# EAGLE board EPGcontrolSWAP (EAGLE 7.7.0)
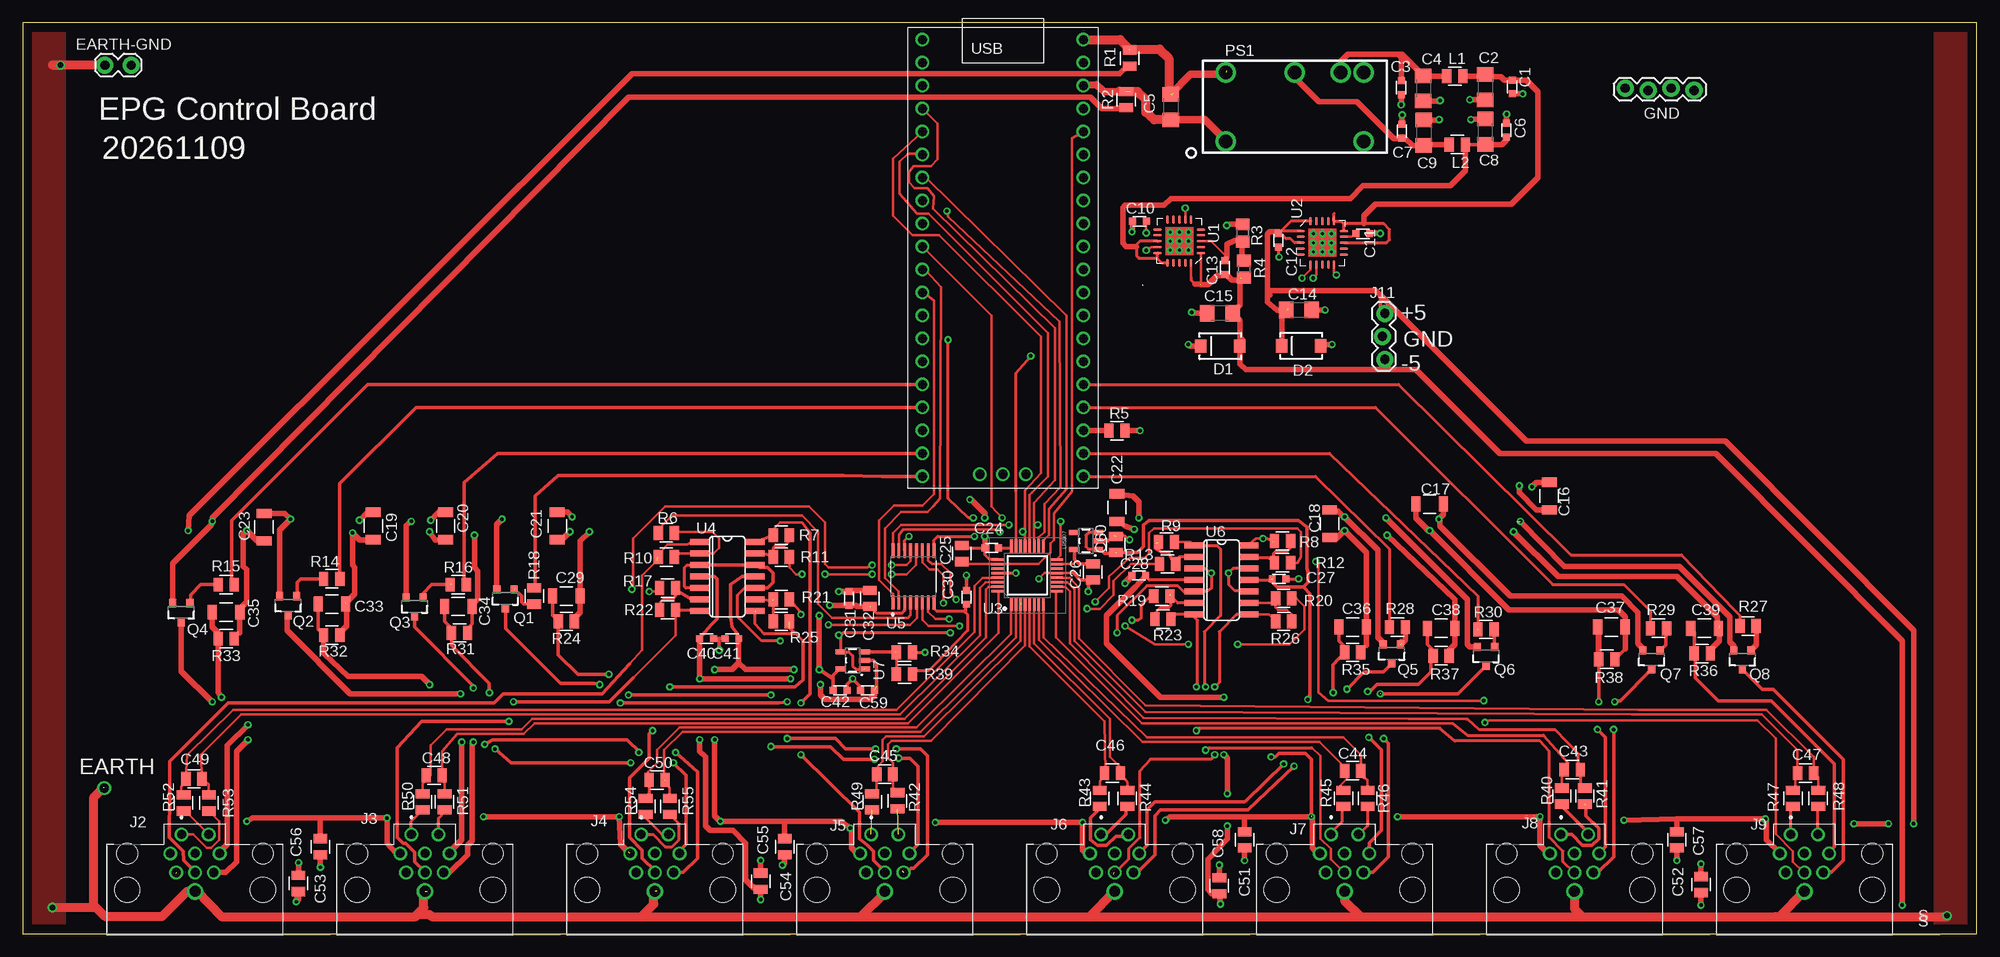
[diagram p1: board, top side]
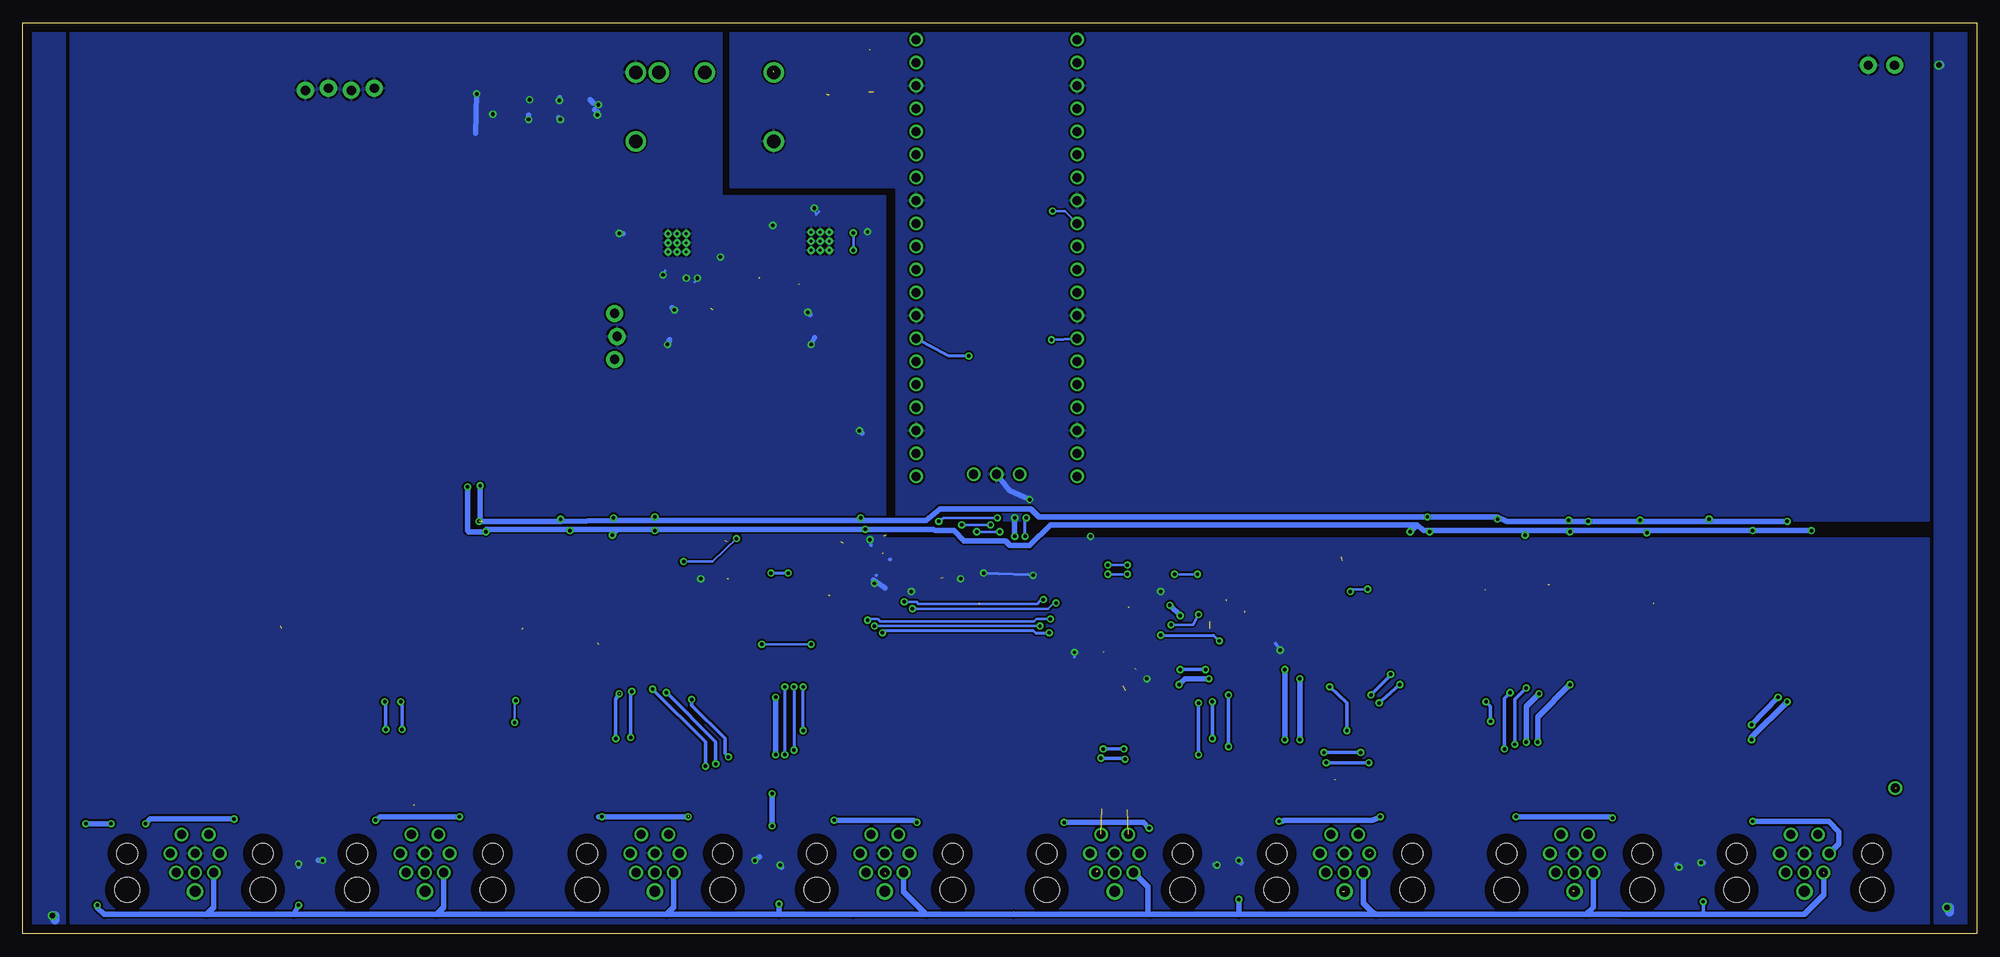
[diagram p2: board, bottom side, seen from below]

Size 215.9 x 100.71 mm. Coordinates in mm from the lower left corner, seen from the top.
Outline: 0,0 215.9,0 215.9,100.71 0,100.71 0,0
Copper layers (1*16): Top 0.035mm / dielectric 1.5mm / Bottom 0.035mm
Design rules "default *": minimum track width 10mil, minimum drill 10mil, track to track 8mil, track to pad 7mil, pad to pad 7mil, via to via 8mil, smd to smd 8mil, copper to edge 40mil, drill to drill 8mil, minimum pad ring 10mil, minimum via ring 8mil, stop-mask expansion 4mil, vias tented up to drill 0mil, thermal gap 10mil

## Footprints (pad centres in the part's own frame; a part is rotated, then mirrored left to right if it is on the bottom)
0603S = smd 0.762 x 0.762: 1 -0.762,0; 2 0.762,0
C1206 = smd 1.6 x 1.8: 1 -1.4,0; 2 1.4,0
1206S = smd 1.016 x 1.651: 1 -1.524,0; 2 1.524,0
0805S = smd 1.016 x 1.524: 1 -0.889,0; 2 0.889,0
SMA-DIODE = smd 1.27 x 1.47: A -2.15,0; C 2.15,0
1X02_LOCK = drill 1.016 pad 1.88: 1 -0.178,0; 2 2.718,0
1X04_LOCK = drill 1.016 pad 1.88: 1 0,0.127; 2 2.54,-0.127; 3 5.08,0.127; 4 7.62,-0.127
PAD_040 = drill 1.016: P$1 0,0
TENSILITY_54-00248 = drill 1 pad 1.4: 1 -1.5,2.1; 2 1.5,2.1; 3 2.725,0; 4 2.075,-2.1; 5 0,-2.1; 6 -2.075,-2.1; 7 -2.725,0; 8 0,0 | drill 1.2 pad 1.7: S1 0,-4.191 | hole 2.3: -7.5,0; 7.5,0 | hole 2.8: -7.5,-4; 7.5,-4
1X03_LOCK = drill 1.016 pad 1.88: 1 0,0.127; 2 2.54,-0.127; 3 5.08,0.127
SOT23-5 = smd 0.55 x 1.2: 1 -0.95,-1.3; 2 0,-1.3; 3 0.95,-1.3; 4 0.95,1.3; 5 -0.95,1.3
PDM2 = drill 1.5: 1 -7.62,-3.81; 7 7.62,-3.81; 8 7.62,3.81; 9 5.08,3.81; 11 0,3.81; 14 -7.62,3.81
SOT23-3 = smd 0.8 x 0.9: 1 -0.95,-1; 2 0.95,-1; 3 0,1.1
R0805 = smd 1.3 x 1.5: 1 -0.95,0; 2 0.95,0
VQFN-20-5X5 = smd 0.95 x 0.3: P$1 -2.4,1.3; P$2 -2.4,0.65; P$3 -2.4,0; P$4 -2.4,-0.65; P$5 -2.4,-1.3; P$11 2.4,-1.3; P$12 2.4,-0.65; P$13 2.4,0; P$14 2.4,0.65; P$15 2.4,1.3 | smd 0.3 x 0.95: P$6 -1.3,-2.4; P$7 -0.65,-2.4; P$8 0,-2.4; P$9 0.65,-2.4; P$10 1.3,-2.4; P$16 1.3,2.4; P$17 0.65,2.4; P$18 0,2.4; P$19 -0.65,2.4; P$20 -1.3,2.4 | drill 0.305: PAD1 -1,1; PAD2 0,1; PAD3 1,1; PAD4 -1,0; PAD5 0,0; PAD6 1,0; PAD7 -1,-1; PAD8 0,-1; PAD9 1,-1
QFP50P700X700X120-32N = smd 1.45 x 0.3: 1 -3.225,1.75; 2 -3.225,1.25; 3 -3.225,0.75; 4 -3.225,0.25; 5 -3.225,-0.25; 6 -3.225,-0.75; 7 -3.225,-1.25; 8 -3.225,-1.75; 17 3.225,-1.75; 18 3.225,-1.25; 19 3.225,-0.75; 20 3.225,-0.25; 21 3.225,0.25; 22 3.225,0.75; 23 3.225,1.25; 24 3.225,1.75 | smd 0.3 x 1.45: 9 -1.75,-3.225; 10 -1.25,-3.225; 11 -0.75,-3.225; 12 -0.25,-3.225; 13 0.25,-3.225; 14 0.75,-3.225; 15 1.25,-3.225; 16 1.75,-3.225; 25 1.75,3.225; 26 1.25,3.225; 27 0.75,3.225; 28 0.25,3.225; 29 -0.25,3.225; 30 -0.75,3.225; 31 -1.25,3.225; 32 -1.75,3.225
SO14 = smd 0.66 x 2.032: 1 -3.81,-3.073; 2 -2.54,-3.073; 3 -1.27,-3.073; 4 0,-3.073; 5 1.27,-3.073; 6 2.54,-3.073; 7 3.81,-3.073; 8 3.81,3.073; 9 2.54,3.073; 10 1.27,3.073; 11 0,3.073; 12 -1.27,3.073; 13 -2.54,3.073; 14 -3.81,3.073
SOP65P640X120-16N = smd 1.57 x 0.41: 1 -2.87,2.275; 2 -2.87,1.625; 3 -2.87,0.975; 4 -2.87,0.325; 5 -2.87,-0.325; 6 -2.87,-0.975; 7 -2.87,-1.625; 8 -2.87,-2.275; 9 2.87,-2.275; 10 2.87,-1.625; 11 2.87,-0.975; 12 2.87,-0.325; 13 2.87,0.325; 14 2.87,0.975; 15 2.87,1.625; 16 2.87,2.275
FT_RASPBERRY-PI-PICO_TH = drill 1: 1 -8.55,24.03; 2 -8.55,21.49; 3 -8.55,18.95; 4 -8.55,16.41; 5 -8.55,13.87; 6 -8.55,11.33; 7 -8.55,8.79; 8 -8.55,6.25; 9 -8.55,3.71; 10 -8.55,1.17; 11 -8.55,-1.37; 12 -8.55,-3.91; 13 -8.55,-6.45; 14 -8.55,-8.99; 15 -8.55,-11.53; 16 -8.55,-14.07; 17 -8.55,-16.61; 18 -8.55,-19.15; 19 -8.55,-21.69; 20 -8.55,-24.23; 21 9.23,-24.23; 22 9.23,-21.69; 23 9.23,-19.15; 24 9.23,-16.61; 25 9.23,-14.07; 26 9.23,-11.53; 27 9.23,-8.99; 28 9.23,-6.45; 29 9.23,-3.91; 30 9.23,-1.37; 31 9.23,1.17; 32 9.23,3.71; 33 9.23,6.25; 34 9.23,8.79; 35 9.23,11.33; 36 9.23,13.87; 37 9.23,16.41; 38 9.23,18.95; 39 9.23,21.49; 40 9.23,24.03; GND 0.34,-24; SWCLK -2.2,-24; SWDIO 2.88,-24

## Placement (x,y rotation side)
C1  0.1  [0603S]  164.56,93.61 270 top
C2  10  [C1206]  161.56,93.57 270 top
C3  0.1  [0603S]  152.3,93.52 270 top
C4  10  [C1206]  154.74,93.44 270 top
C5  10  [C1206]  126.84,91.37 270 top
C6  0.1  [0603S]  163.92,88.84 90 top
C7  0.1  [0603S]  152.39,88.72 270 top
C8  10  [C1206]  161.61,88.64 90 top
C9  10  [C1206]  154.77,88.54 270 top
C10  0.1  [0603S]  123.39,78.76 180 top
C11  0.1  [0603S]  148.06,77.37 0 top
C12  0.1  [0603S]  138.75,76.65 270 top
C13  0.1  [0603S]  132.82,73.63 90 top
C14  47  [C1206]  141.01,68.97 0 top
C15  47  [C1206]  132.26,68.59 180 top
C16  10  [1206S]  168.66,48.39 270 top
C17  10  [1206S]  155.45,47.5 0 top
C18  10  [1206S]  144.4,45.34 90 top
C19  10  [1206S]  38.73,45.09 90 top
C20  10  [1206S]  46.74,45.09 90 top
C21  10  [1206S]  59.05,45.09 90 top
C22  10  [1206S]  120.9,47.12 90 top
C23  10  [1206S]  26.67,44.96 90 top
C24  220n  [0603S]  107.06,42.67 180 top
C25  1  [0805S]  103.76,42.04 90 top
C26  1  [0805S]  118.24,40.01 270 top
C27  0.1  [0603S]  138.81,39.24 0 top
C28  0.1  [0603S]  123.32,39.62 0 top
C29  10  [1206S]  60.07,37.34 180 top
C30  150n  [0603S]  104.27,37.21 90 top
C31  0.1  [0603S]  91.31,37.08 90 top
C32  1  [0805S]  93.6,37.08 90 top
C33  10  [1206S]  34.16,36.45 180 top
C34  10  [1206S]  48.13,36.2 180 top
C35  10  [1206S]  22.48,35.56 180 top
C36  10  [1206S]  146.94,33.91 180 top
C37  10  [1206S]  175.51,33.91 180 top
C38  10  [1206S]  156.72,33.78 180 top
C39  10  [1206S]  185.8,33.78 180 top
C40  0.1  [0603S]  75.56,32.64 180 top
C41  0.1  [0603S]  78.36,32.64 180 top
C42  0.1  [0603S]  90.3,26.92 0 top
C43  4.7n  [0805S]  171.2,18.16 0 top
C44  4.7n  [0805S]  146.94,18.03 180 top
C45  4.7n  [0805S]  95.25,17.65 180 top
C46  4.7n  [0805S]  120.4,17.78 0 top
C47  4.7n  [0805S]  196.98,17.78 180 top
C48  4.7n  [0805S]  45.47,17.53 180 top
C49  4.7n  [0805S]  18.92,17.14 0 top
C50  4.7n  [0805S]  70.1,17.02 0 top
C51  1  [0805S]  135,10.41 270 top
C52  1  [0805S]  182.75,10.41 270 top
C53  1  [0805S]  32.89,9.65 270 top
C54  1  [0805S]  84.2,9.65 270 top
C55  1  [0805S]  81.53,5.84 90 top
C56  1  [0805S]  30.48,5.59 90 top
C57  1  [0805S]  185.42,5.46 90 top
C58  1  [0805S]  132.21,5.33 90 top
C59  0.1  [0603S]  93.34,26.92 180 top
C60  1  [0805S]  120.78,43.05 90 top
D1  [SMA-DIODE]  132.31,64.97 180 top
D2  [SMA-DIODE]  141.25,65 180 top
EARTH-GND  [1X02_LOCK]  9.27,96.01 0 top
GND  [1X04_LOCK]  177.04,93.34 0 top
J1  [PAD_040]  9.02,16.13 0 top
J2  54-00248  [TENSILITY_54-00248]  19.05,8.89 0 top
J3  54-00248  [TENSILITY_54-00248]  44.45,8.89 0 top
J4  54-00248  [TENSILITY_54-00248]  69.85,8.89 0 top
J5  54-00248  [TENSILITY_54-00248]  95.25,8.89 0 top
J6  54-00248  [TENSILITY_54-00248]  120.65,8.89 0 top
J7  54-00248  [TENSILITY_54-00248]  146.05,8.89 0 top
J8  54-00248  [TENSILITY_54-00248]  171.45,8.89 0 top
J9  54-00248  [TENSILITY_54-00248]  196.85,8.89 0 top
J11  [1X03_LOCK]  150.37,68.58 270 top
L1  FERRITE BEAD  [0805S]  158.22,94.79 0 top
L2  FERRITE BEAD  [0805S]  158.49,87.24 0 top
LP5907  TP5907  [SOT23-5]  117.47,43.43 90 top
PS1  NMH0509DC  [PDM2]  140.54,91.4 0 top
Q1  600mA/40V  [SOT23-3]  53.34,37.08 180 top
Q2  600mA/40V  [SOT23-3]  29.34,36.32 180 top
Q3  600mA/40V  [SOT23-3]  43.31,36.2 180 top
Q4  600mA/40V  [SOT23-3]  17.53,35.56 180 top
Q5  600mA/40V  [SOT23-3]  151.26,30.99 180 top
Q6  600mA/40V  [SOT23-3]  161.67,30.73 180 top
Q7  600mA/40V  [SOT23-3]  179.96,30.35 180 top
Q8  600mA/40V  [SOT23-3]  189.99,30.35 180 top
R1  0  [0805S]  122.3,96.77 90 top
R2  0  [0805S]  121.92,92.2 90 top
R3  102K  [R0805]  134.77,77.47 270 top
R4  332K  [R0805]  134.93,73.47 270 top
R5  0  [0805S]  120.9,55.63 180 top
R6  49K9  [0805S]  71.12,44.32 0 top
R7  2K00  [0805S]  83.82,44.07 180 top
R8  2K00  [0805S]  139.19,43.43 180 top
R9  2K00  [0805S]  126.36,43.31 0 top
R10  2K00  [0805S]  71.12,41.66 180 top
R11  49K9  [0805S]  83.82,41.66 180 top
R12  49K9  [0805S]  139.19,41.02 180 top
R13  49K9  [0805S]  126.49,40.89 0 top
R14  1K00  [0805S]  34.16,39.24 0 top
R15  1K00  [0805S]  22.48,38.61 0 top
R16  1K00  [0805S]  48.13,38.61 0 top
R17  49K9  [0805S]  71.25,38.23 0 top
R18  1K00  [0805S]  56.52,37.34 90 top
R19  49K9  [0805S]  125.86,37.34 0 top
R20  49K9  [0805S]  139.32,37.08 180 top
R21  49K9  [0805S]  83.82,36.96 180 top
R22  2K00  [0805S]  71.25,35.81 0 top
R23  2K00  [0805S]  125.98,34.8 0 top
R24  1K00  [0805S]  60.07,34.54 0 top
R25  2K00  [0805S]  83.82,34.54 0 top
R26  2K00  [0805S]  139.32,34.54 180 top
R27  1K00  [0805S]  190.63,34.04 180 top
R28  1K00  [0805S]  151.89,33.91 180 top
R29  1K00  [0805S]  180.72,33.78 180 top
R30  1K00  [0805S]  161.67,33.66 180 top
R31  1K00  [0805S]  48.26,33.27 0 top
R32  1K00  [0805S]  34.16,33.02 0 top
R33  1K00  [0805S]  22.48,32.64 0 top
R34  1K02  [0805S]  97.41,31.11 180 top
R35  1K00  [0805S]  146.94,31.11 0 top
R36  1K00  [0805S]  185.55,30.99 0 top
R37  1K00  [0805S]  156.72,30.73 0 top
R38  1K00  [0805S]  175.01,30.35 0 top
R39  49K9  [0805S]  97.41,28.7 0 top
R40  49R9  [0805S]  170.05,15.24 90 top
R41  49R9  [0805S]  172.59,15.24 90 top
R42  49R9  [0805S]  96.65,14.73 90 top
R43  49R9  [0805S]  119,14.99 90 top
R44  49R9  [0805S]  122.05,14.99 90 top
R45  49R9  [0805S]  145.92,14.99 90 top
R46  49R9  [0805S]  148.59,14.99 90 top
R47  49R9  [0805S]  195.58,14.99 90 top
R48  49R9  [0805S]  198.37,14.99 90 top
R49  49R9  [0805S]  93.85,14.61 90 top
R50  49R9  [0805S]  44.2,14.61 90 top
R51  49R9  [0805S]  46.61,14.61 90 top
R52  49R9  [0805S]  17.78,14.48 90 top
R53  49R9  [0805S]  20.57,14.48 90 top
R54  49R9  [0805S]  68.83,14.1 90 top
R55  49R9  [0805S]  71.5,14.1 90 top
U1  TPS7A33  [VQFN-20-5X5]  127.79,76.56 180 top
U2  TPS7A470X  [VQFN-20-5X5]  143.59,76.38 0 top
U3  ADS131M08QPBSRQ1  [QFP50P700X700X120-32N]  111,39.62 90 top
U4  QUAD_OPAMPD  [SO14]  77.85,39.5 270 top
U5  DAC8568IBPW  [SOP65P640X120-16N]  98.42,39.5 90 top
U6  QUAD_OPAMPD  [SO14]  132.46,39.12 270 top
U7  OPA344  [SOT23-5]  91.69,30.23 90 top
U$1  RASPBERRY-PI-PICO_TH  [FT_RASPBERRY-PI-PICO_TH]  107.95,74.8 0 top

## Tracks (layer width: path | path; a pad name or v marks a point on that pad's centre or on a via)
0V05  (1 unrouted)
  Top 0.305: R34.2 R39.1
  Top 0.406: U7.3 96.45,31.18 96.52,31.24 96.27,31.24
2V5REF
  Top 0.305: U5.8 100.7,35.95 100.97,35.69 104.01,35.69 104.14,35.56 104.39,35.31 104.39,33.53 100.78,29.78 100.08,29.08 98.68,29.08 R39.2
  Top 0.406: C30.1 104.14,36.45 104.14,35.56
3V3A
  Top 0.254: U3.15 116.06,40.87 116.39,41.21
  Top 0.406: C26.1 116.71,40.89 116.39,41.21 116.2,41.4 116.2,42.45 LP5907.5
3V3D
  Top 0.254: U$1.36 115.95,87.95 115.95,48.9 113.92,46.48 113.92,43.56 113.54,43.18 113.54,42.16 112.25,40.87 U3.26 104.03,40.87
  Top 0.305: 104.03,40.87 C25.1
5V0  (via drill 0.38)  (6 unrouted)
  Top 0.305: U2.P$1 139.03,77.69 C12.1 | U2.P$20 140.13,78.78 C12.1 | U2.P$3 140.53,76.39 140.08,76.83 139.57,76.83 138.81,77.6 138.81,77.47 C12.1 | U6.11 137.79,39.12 137.92,39.24 | U5.3 97.45,35.73 97.16,35.43 94.36,35.43 93.73,36.07 | LP5907.3 117.79,44.38 117.47,44.07 117.47,42.8 117.73,42.55 118.71,42.55 LP5907.1
  Top 0.406: U4.11 79.5,39.5 78.23,38.61 78.23,35.05 78.36,33.91 78.99,33.15 79.12,32.77 C41.1 | C27.1 138.05,38.86 138.56,38.35 141.48,38.35 141.6,38.23 | 141.6,38.23 142.24,37.59 142.24,26.16 v141.99,25.91 | J11.1 149.99,68.58 149.99,70.61 | v137.92,19.56 138.43,19.56 138.81,19.94 141.73,19.94 142.37,19.3 142.37,13.08 142.49,12.95 | LP5907.1 119.06,42.48 119.51,42.04 120.9,42.04 | 141.6,38.23 141.6,38.48 141.99,38.86 141.99,40.01 141.86,40.39 141.86,44.96 140.97,45.72 124.46,45.72 123.83,45.21 123.83,42.8 123.19,42.16 C60.1 | U7.5 90.24,29.28 89.53,28.57 89.53,28.45 | 89.53,28.45 C42.1 | v88.01,29.21 89.41,28.32 89.53,28.45
  Top 0.61: 138.81,77.6 137.79,77.6 137.54,77.34 137.54,70.87 | 137.54,70.87 137.54,69.85 138.56,68.96 139.6,68.96 C14.1 | v85.22,29.21 79.88,29.21 79.12,29.97 | 79.12,29.97 79.12,32.77 | D2.C 139.1,65.15 | 139.1,65.15 139.1,68.37 139.83,69.09 | v88.01,35.18 v88.01,29.21 | 139.06,65.11 139.1,65.15 | v89.15,36.32 C31.1 92.08,36.32 92.2,36.2 C32.1 | 137.67,70.74 137.67,70.87 137.92,71.12 149.48,71.12 149.99,70.61 166.12,54.48 188.09,54.48 208.91,33.53 208.91,12.7 v208.91,12.19 | 137.67,70.74 137.79,70.61 | 137.67,70.74 137.54,70.87 | v24.77,12.45 25.4,12.83 32.89,12.83 | 32.89,12.83 v40.26,12.83 40.26,10.03 41.27,8.89 J3.7 | v50.93,12.95 v65.91,12.95 66.04,9.91 66.93,9.02 | v77.09,12.45 77.22,12.45 | 77.22,12.45 84.2,12.45 | 84.2,12.45 90.42,12.45 v91.44,11.68 91.57,11.56 91.57,9.53 92.2,8.89 J5.7 | v100.84,12.32 v117.09,12.32 117.09,9.27 117.47,8.89 J6.7 | v126.24,12.57 126.75,12.95 134.87,12.95 | 134.87,12.95 142.24,12.95 | 142.24,12.95 v142.37,12.95 | v151.89,12.95 v167.64,12.95 167.64,9.78 168.53,8.89 J8.7 | v176.91,12.57 182.75,12.7 | 182.75,12.7 v192.53,12.7 192.66,12.57 192.66,10.41 194.12,8.95 J9.7 | v202.31,12.19 v206.12,12.19 | C51.1 135,12.83 134.87,12.95 | C52.1 182.75,12.7 | C54.1 84.2,12.45 | C53.1 32.89,12.83 | J7.7 143.32,8.95 143.07,8.95 142.49,9.53 142.49,12.7 142.24,12.95 | v76.45,21.46 76.45,13.08 76.96,12.57 77.09,12.57 77.22,12.45 | v76.45,29.21 78.36,29.21 79.12,29.97
  Bottom 0.406: v85.22,29.21 v88.01,29.21 | v141.99,25.91 141.99,25.27 138.3,21.59 138.3,19.94 v137.92,19.56
  Bottom 0.61: v76.45,29.21 v76.45,21.46 | v89.15,36.32 v88.01,35.18 | v40.26,12.83 40.64,12.95 v50.93,12.95 | v65.91,12.95 66.8,12.57 76.58,12.57 76.71,12.45 v77.09,12.45 | v91.44,11.68 92.08,12.32 v100.84,12.32 | v117.09,12.32 117.47,12.57 v126.24,12.57 | v142.37,12.95 v151.89,12.95 152.27,12.95 | v167.64,12.95 176.4,12.95 v176.91,12.57 | v192.53,12.7 201.8,12.7 v202.31,12.19 | v206.12,12.19 v208.91,12.19 | v24.77,12.45 16.38,12.45 15.24,11.3 15.24,9.97 J2.7
5VD  (via drill 0.38)  (2 unrouted)
  Top 0.406: C37.1 177.04,31.5 R38.2 | R35.2 147.83,31.24 148.46,31.88 C36.1 | R31.2 49.15,33.78 49.66,34.29 C34.1 | R33.2 24,33.27 C35.1
  Top 0.61: 24,33.27 24,35.94 24.77,36.7 24.77,40.26 24.38,40.64 24.38,44.2 v24.77,44.58 25.91,43.43 C23.1 | R32.2 35.05,33.27 35.81,34.04 35.81,36.58 35.69,36.7 35.69,36.58 36.7,37.59 36.7,40.51 36.45,40.77 v36.45,44.32 37.21,43.56 C19.1 | C34.1 49.66,36.32 50.29,36.96 50.29,40.13 49.91,40.51 v49.91,44.07 | R24.2 60.96,34.92 61.59,35.56 C29.1 61.59,43.43 v62.61,44.45 | 148.46,31.88 148.46,42.16 v146.05,44.58 145.16,43.69 C18.1 | R37.2 157.61,31.37 158.24,32 C38.1 158.24,36.96 v150.75,44.07 | 177.04,31.5 177.04,35.05 176.28,35.81 164.21,35.81 v155.45,44.58 155.32,44.58 153.92,45.97 C17.1 | R36.2 186.44,31.37 187.45,32.38 187.45,34.04 187.2,34.29 187.2,35.05 182.75,39.5 169.67,39.5 v164.72,44.45 | C16.1 167.26,49.91 v166.75,49.4 | C22.1 121.79,45.09 v122.81,44.7 | C20.1 45.59,43.56 v44.96,44.45 | C21.1 59.56,43.56 v60.45,44.45 | v18.29,44.58 18.41,46.23 67.31,95.05 121.16,95.05 122.17,96.01 R1.1
  Bottom 0.61: 36.45,44.58 v24.77,44.58 v18.29,44.58 | 36.45,44.58 45.47,44.58 | 45.47,44.58 49.91,44.58 | 61.85,45.21 61.09,44.58 60.45,44.58 | 61.85,45.21 102.36,45.21 104.65,42.93 106.81,42.93 107.31,43.43 111.89,43.43 113.03,44.58 115.06,44.58 115.32,44.7 v122.81,44.7 145.92,44.7 | 145.92,44.7 150.24,44.7 | 150.24,44.7 155.32,44.7 | 155.32,44.7 164.72,44.7 v164.72,44.45 166.62,44.45 166.75,44.58 v166.75,49.4 | v36.45,44.32 36.45,44.58 | v49.91,44.07 49.91,44.58 | 49.91,44.58 60.45,44.58 | v62.61,44.45 61.85,45.21 | v146.05,44.58 145.92,44.7 | v150.75,44.07 150.24,44.7 | v155.45,44.58 155.32,44.7 | v44.96,44.45 45.47,44.58 | v60.45,44.45 60.45,44.58
+9V
  Top 0.61: PS1.9 145.62,96.42 146.4,97.19 152,97.19 | 152,97.19 152.38,97.19 C4.1 154.79,94.79 L1.1 | C3.1 152.3,96.89 152,97.19
-5V0  (via drill 0.38)  (5 unrouted)
  Top 0.28: U1.P$1 130.19,71.74 | U1.P$20 129.09,72.54 | 134.57,72.43 R4.2
  Top 0.305: 129.09,72.54 129.09,72.25 129.53,71.81 | U6.4 124.46,39.12 124.08,39.5 C28.2
  Top 0.406: v30.23,3.56 30.23,4.06 30.73,4.57 | U4.4 76.45,39.5 76.71,39.24 76.71,34.8 76.07,34.16 C40.2 | J11.3 150.62,63.5 150.62,62.36 | 94.36,27.43 94.36,29.84 93.98,30.23 U7.2
  Top 0.61: 129.53,71.81 130.05,71.79 | R4.2 134.67,72.26 133.57,72.26 132.97,72.87 C13.1 132.72,72.77 131.95,72.77 130.94,71.75 130.18,71.75 | D1.A 134.47,67.8 C15.1 133.66,68.64 134.49,69.47 134.49,72.52 | 134.75,65.66 134.62,65.66 | 134.62,65.66 134.52,65.66 D1.A | C56.1 30.48,3.81 v30.23,3.56 | v81.53,3.81 C55.1 81.66,5.08 | C58.1 132.22,4.33 | 132.22,4.33 v132.33,3.3 | C57.1 v185.42,3.17 | C40.2 v74.8,28.19 v84.84,28.19 | v132.72,26.16 125.73,26.16 119.76,32.13 119.76,35.18 122.94,38.35 C28.2 | v132.72,19.81 133.1,19.43 v133.1,15.49 | 132.22,4.33 132.11,4.45 131.32,4.45 130.94,4.95 130.94,8.26 133.1,10.54 v133.1,11.94 | v207.65,3.17 207.65,32.38 187.07,53.09 163.19,53.09 153.92,62.36 150.62,62.36 135.13,62.36 134.49,62.99 134.49,65.53 134.62,65.66 | 134.49,65.58 D1.A | v74.8,21.46 74.8,20.19 75.44,19.56 75.44,11.94 75.95,11.43 78.49,11.43 79.88,10.03 79.88,5.97 80.77,5.08 81.66,5.08 | 81.79,5.08 81.66,5.08 | v88.14,27.56 88.14,26.42 88.65,25.91 93.6,25.91 94.11,26.42 C59.1
  Bottom 0.254: 106.43,2.41 106.43,2.16
  Bottom 0.305: 124.21,2.29 124.21,2.16
  Bottom 0.406: 39.18,2.16 30.23,2.16 30.23,3.43
  Bottom 0.61: 43.18,2.16 39.18,2.16 19.05,2.16 16.89,4.32 16.89,6.73 | 43.18,2.16 66.42,2.16 | 66.42,2.16 81.53,2.16 | 81.53,2.16 91.31,2.16 | 91.31,2.16 106.43,2.16 116.08,2.16 | 116.08,2.16 124.21,2.16 132.33,2.16 | 132.33,2.16 144.78,2.16 | 144.78,2.16 170.18,2.16 | 170.18,2.16 185.93,2.16 | 185.93,2.16 195.58,2.16 | v30.23,3.56 30.23,3.43 | v81.53,3.81 81.53,2.16 | v132.33,3.3 132.33,2.16 | v185.42,3.17 185.93,2.16 | v74.8,28.19 v74.8,21.46 | v132.72,26.16 v132.72,19.81 | 195.58,2.16 206.88,2.16 207.65,2.92 v207.65,3.17 | J4.6 67.78,3.39 66.67,2.29 66.55,2.29 66.42,2.16 | J5.6 93.15,6.79 91.57,5.21 91.57,2.41 91.31,2.16 | J6.6 118.58,4.66 116.08,2.16 | v133.1,11.94 v133.1,15.49 | J7.6 143.97,2.96 144.78,2.16 | J8.6 169.38,2.96 170.18,2.16 | J9.6 194.78,2.96 195.58,2.16 | J3.6 42.38,2.96 43.18,2.16 | v84.84,28.19 87.5,28.19 v88.14,27.56
-9V
  Top 0.61: PS1.11 140.54,94.65 143.19,92 147.4,92 151.5,87.89 152.33,87.89 C7.2 152.73,87.96 153.59,87.09 154.73,87.09 C9.2 154.87,87.24 L2.1
A0N
  Top 0.254: 21.08,15.24 R53.2 20.57,16.51 C49.2 19.68,19.81 24.13,24.26 24.38,24.26 35.06,24.27 96.91,24.27 105.79,33.02 105.79,38.23 106.36,38.86 U3.30
A0P
  Top 0.254: R52.2 17.65,15.37 17.53,15.24 17.53,16.26 C49.1 18.16,19.81 23.25,24.77 96.52,24.77 105.16,33.4 105.16,38.48 106.05,39.37 U3.29
A1N
  Top 0.254: U3.31 106.7,38.37 106.43,38.1 106.43,32.77 97.43,23.77 56.28,23.77 55.12,22.61 46.86,22.61 45.09,20.83 45.09,17.53 C48.2 44.2,16.51 R50.2
A1P
  Top 0.254: C48.1 46.23,17.27 | U3.32 107.82,37.67 107.82,33.27 97.82,23.27 56.54,23.27 55.37,22.1 48.01,22.1 46.35,20.19 C48.1 | R51.2 46.61,16.64 C48.1
A2N  (1 unrouted)
  Top 0.254: 70.87,17.27 C50.2 71.5,16.13 R55.2 | U3.2 109.75,32.79 99.19,22.35 72.9,22.35 70.87,20.32 70.87,17.02
A2P
  Top 0.254: U3.1 109.22,36.37 109.22,33.15 98.76,22.81 72.59,22.81 70.1,20.32 70.1,18.92 69.09,17.91 69.09,17.14 C50.1
  Top 0.305: C50.1 69.22,15.49 R54.2
A3N  (1 unrouted)
  Top 0.254: R49.2 94.36,15.88 C45.2 94.49,17.78 94.49,18.54 95,19.05 95,21.46 95.38,21.84 99.57,21.84 110.24,32.38 110.24,36.58
A3P
  Top 0.254: R42.2 96.77,15.49 96.14,16 C45.1 96.27,17.78 | U3.4 110.75,31.88 100.33,21.34 96.01,21.34 95.63,20.95 95.63,19.43 96.14,18.92 96.14,17.91 96.27,17.78 | 96.39,17.65 96.27,17.78
A4N
  Top 0.254: R44.2 122.05,16.76 C46.2 121.16,17.78 121.16,18.54 120.14,19.56 120.14,23.75 111.76,32.13 111.76,36.39 U3.6
A4P
  Top 0.254: R43.2 119,16.89 C46.1 119.63,17.78 | 119.63,17.78 119.63,18.16 | U3.5 111.25,31.75 119.51,23.5 119.63,17.78
A5N
  Top 0.254: R45.2 145.29,16.13 146.3,17.14 C44.2 145.8,18.67 143.26,21.21 123.7,21.21 112.27,32.51 112.27,36.38 U3.7
A5P
  Top 0.254: 148.59,15.75 R46.2 148.59,17.02 148.21,17.27 C44.1 147.83,19.81 145.92,21.72 124.21,21.72 112.78,32.77 112.78,36.37 U3.8
A6N
  Top 0.254: 159.49,23.77 153.14,23.77 123.81,23.9 115.7,32.13 115.7,37.85 115.19,38.35 114.24,38.35 U3.10
  Top 0.305: 159.49,23.77 159.62,23.77 160.91,22.61 169.29,22.61 171.83,19.94 171.83,18.41 C43.2 172.09,16.51 R41.2
A6P
  Top 0.254: C43.1 170.18,17.91 170.05,17.27 R40.2 | 157.96,23.27 123.67,23.27 114.17,32.77 114.17,37.82 U3.9
  Top 0.305: 157.96,23.27 159.64,21.97 168.02,21.97 170.69,18.92 C43.1
A7N
  Top 0.254: R47.2 195.83,16.38 195.83,17.65 196.22,17.91 C47.2 196.09,20.32 192.14,24.27 177.79,24.27 124.07,24.52 116.2,32.38 116.2,38.1 115.44,38.86 114.23,38.86 U3.11
A7P  (1 unrouted)
  Top 0.254: R48.2 198.37,17.27 197.99,17.78 C47.1 197.87,19.56 192.66,24.77 178.56,24.77 124.08,25.28 116.71,32.64 116.71,38.23 115.7,39.37 114.43,39.37
ADCCLK  (via drill 0.38)
  Top 0.254: U3.23 109.75,46.84 109.73,48.9
  Top 0.305: 109.73,48.9 109.73,61.98 v111.38,63.88
  Bottom 0.305: v111.38,63.88 113.6,63.88 U$1.27
ADCCS
  Top 0.254: U$1.7 99.37,83.69 99.69,83.69 115.32,68.33 115.32,49.15 113.41,46.99 113.41,44.07 112.75,43.41 U3.17
ADCRDY  (via drill 0.38)
  Top 0.254: v102.11,79.88 102.23,79.25 114.55,67.69 114.68,49.4 112.9,47.5 112.9,44.45 112.25,43.8 U3.18
  Bottom 0.254: v102.11,79.88 100.77,79.88 U$1.9
ADCSYNC  (via drill 0.38)
  Top 0.254: U$1.10 107.06,68.31 107.06,47.24 v108.2,45.97 | v114.68,45.59 114.68,41.8 U3.16
  Bottom 0.254: v108.2,45.97 114.17,45.97 v114.68,45.59
AGND  (via drill 0.38, 0.4)  (1 unrouted)
  Top 0.254: 116.08,39.88 115.44,39.87 U3.13 112.9,39.87 v112.27,39.24
  Top 0.28: U2.P$7 142.94,72.89 v142.59,72.48 | U1.P$7 128.44,80.09 v128.43,80.21 | U2.P$10 144.89,73.06 v145.14,72.82 | U2.P$6 142.29,73.44 v141.34,72.48
  Top 0.305: C12.2 138.75,74.86 v138.81,74.8 | U3.28 109.48,39.87 v109.73,39.88 | C27.2 v140.97,39.24 | R34.1 v99.69,31.11 | U5.14 97.45,43.48 v97.92,43.94
  Top 0.406: 76.96,32.64 C40.1 | C41.2 76.96,32.64 | 76.96,32.64 v76.96,31.37 | 116.08,39.88 116.84,39.12 C26.2 117.73,38.86 v117.73,37.85 | C30.2 v104.27,39.62 | LP5907.2 119.89,43.43 120.52,44.07 121.54,44.07 v122.3,43.56 | C42.2 91.06,27.56 v91.69,28.19 92.58,27.3 C59.2
  Top 0.61: C11.2 149.28,77.42 v149.99,77.43 | R3.1 133.45,78.42 v133.02,78.32 | C14.2 143.88,68.97 v143.89,68.96 | D2.A 143.91,65.13 v144.65,65.15 | D1.C 128.96,64.97 v128.78,65.15 | C15.2 129.27,68.59 v129.16,68.71 | C56.2 v30.48,7.87 | C53.2 v32.89,7.37 | C55.2 v81.53,8.13 | C54.2 84.2,7.87 v83.95,7.62 | C58.2 v132.21,7.62 | C51.2 v135,8.13 | C57.2 v185.42,7.75 | C52.2 v182.75,8.13 | C10.2 122.62,77.67 v122.56,77.6 | C32.2 91.44,37.97 C31.2 v90.17,37.85 | C28.1 121.67,38.73 122.3,39.24 v121.79,38.73 | R5.1 v123.44,55.63 | C9.1 156.44,89.94 v156.5,90 | C4.2 156.54,92.04 v156.59,92.09 | C7.1 v152.39,90.49 v152.4,90.5 | C3.2 152.3,91.65 v152.29,91.64 | C2.2 159.92,92.17 v159.9,92.19 | C1.2 165.47,92.84 v165.74,92.84 | C8.2 160.04,90.04 v160,90 | C6.2 163.92,90.32 v163.94,90.59
  Bottom 0.254: v112.27,39.24 112.27,39.5 112.14,39.37
  Bottom 0.28: v142.59,72.48 142.69,72.58 | v128.43,80.21 128.22,79.51 127.92,79.81 | v145.14,72.82 144.92,73.31 | v141.34,72.48 141.69,72.03
  Bottom 0.305: v138.81,74.8 138.81,74.55 | v109.73,39.88 104.78,39.75 104.65,39.62 | 121.67,39.62 121.54,39.62 | v140.97,39.24 140.97,38.99 | v99.69,31.11 99.69,30.61 | v97.92,43.94 97.92,43.81
  Bottom 0.406: v76.96,31.37 77.47,32.13 | v117.73,37.85 117.47,37.97 | v104.27,39.62 104.14,39.62 | 120.14,41.4 120.02,41.4 | v122.3,43.56 122.17,42.93 | v91.69,28.19 91.57,28.07
  Bottom 0.61: v149.99,77.43 149.54,77.38 | v133.02,78.32 132.97,78.29 132.91,78.31 | v143.89,68.96 144.15,69.22 | v144.65,65.15 144.4,65.66 | v128.78,65.15 128.4,65.91 | v129.16,68.71 128.91,68.45 | v30.48,7.87 30.23,7.87 | v32.89,7.37 33.15,7.62 | v81.53,8.13 81.28,7.87 | v83.95,7.62 84.2,7.62 | v132.21,7.62 132.33,7.62 132.08,7.37 | v135,8.13 134.49,8.51 | v185.42,7.75 185.42,7.49 | v182.75,8.13 183.26,8.13 | v122.56,77.6 122.68,77.6 | v90.17,37.85 90.17,37.72 | v121.79,38.73 121.92,39.12 120.65,38.23 | v123.44,55.63 123.19,55.37 | v156.5,90 156.69,90.19 | v156.59,92.09 156.59,92.39 | v152.4,90.5 152.4,90.8 152.69,91.09 | v152.29,91.64 152.79,91.8 153.19,92.19 | v159.9,92.19 159.9,92.3 | v165.74,92.84 165.86,88.52 | v160,90 160,90.5
  pour Bottom: 5.33,43.69 120.65,43.69 120.65,81.53 138.68,81.53 138.68,101.6 210.57,101.47 210.57,-1.4 5.33,-1.14
AIN0N
  Top 0.254: J2.1 18.86,10.99 20.32,9.53 20.83,9.53 21.72,10.41 21.72,12.45 R53.1
AIN0P
  Top 0.254: 17.55,13.36 R52.1 17.95,13.59 J2.2
AIN1N
  Top 0.254: 44.32,13.34 R50.1
  Top 0.305: J3.1 42.95,12.47 R50.1
AIN1P
  Top 0.305: J3.2 45.95,12.8 46.74,13.59 R51.1
AIN2N
  Top 0.254: R55.1 71.48,13.09
  Top 0.305: J4.1 69.66,10.99 70.99,9.65 71.75,9.65 72.52,10.41 72.52,12.19 71.37,13.34 71.37,13.19 71.48,13.09
AIN2P
  Top 0.254: 68.96,12.95 68.89,13.11 R54.1
  Top 0.305: J4.2 70.67,10.99 68.83,12.83 68.83,12.95 68.71,13.08 68.86,13.08 68.89,13.11
AIN3N  (1 unrouted)
AIN3P  (1 unrouted)
AIN4N
  Top 0.254: R44.1 122.17,13.94
  Top 0.406: J6.1 119.7,10.99 121.92,13.21 121.92,13.97 R44.1
AIN4P
  Top 0.254: R43.1 119.13,13.97
  Top 0.406: J6.2 122.15,10.95 122.3,10.79 120.78,10.79 119.76,9.78 118.75,9.78 117.98,10.41 117.98,12.83 119.13,13.97
AIN5N
  Top 0.305: J7.1 144.55,11.2 145.8,12.45 145.8,13.97 R45.1
AIN5P
  Top 0.305: R46.1 148.59,11.94 147.45,10.79 147.45,10.89 J7.2
AIN6N  (1 unrouted)
  Top 0.406: J8.1 171.13,10.99 172.34,9.78 173.35,9.78 174.12,10.54 174.12,11.68 172.72,13.08 172.72,14.22 172.47,14.48
AIN6P
  Top 0.406: J8.2 172.95,11.2 169.93,14.22 R40.1
AIN7N
  Top 0.254: 195.96,13.72 195.96,14.22 196.09,13.97 195.73,14.06 R47.1
  Top 0.305: J9.1 195.35,13.68 195.73,14.06
AIN7P
  Top 0.305: J9.2 198.35,14.07 R48.1
DAC0
  Top 0.254: U5.4 98.1,35.23 97.79,34.92 89.41,34.92 87.88,36.45 87.88,44.45 86.11,46.23 71.75,46.23 70.23,44.7 R6.1
DAC1  (via drill 0.38)
  Top 0.254: U5.13 98.1,41.2 97.66,40.77 v96.01,40.77 | v93.85,40.77 93.34,40.51 89.03,40.51 88.65,40.89 88.65,45.47 86.87,47.24 70.99,47.24 67.44,43.69 67.44,38.23 v67.31,38.1 | v69.22,37.85 70.61,37.85 R17.1
  Bottom 0.254: v96.01,40.77 v93.85,40.77 | v67.31,38.1 69.09,38.1 v69.22,37.85
DAC2  (via drill 0.38)
  Top 0.254: R21.1 85.85,35.69 v85.98,35.31 | v89.03,34.16 98.04,34.16 98.81,34.92 98.81,36.57 U5.5
  Bottom 0.254: v85.98,35.31 86.61,34.16 v89.03,34.16
DAC3  (via drill 0.38)
  Top 0.254: R11.1 84.71,40.51 85.47,39.75 v86.11,39.75 | v88.65,39.75 v93.85,39.75 | v96.01,39.75 97.66,39.75 98.68,40.77 98.68,42.3 U5.12
  Bottom 0.254: v86.11,39.75 v88.65,39.75 | v93.85,39.75 v96.01,39.75
DAC4  (via drill 0.38)
  Top 0.254: U5.6 99.4,34.71 100.08,34.04 v103.5,34.04 | v121.79,34.04 125.09,32 v128.78,32 | R20.1 140.72,37.08 141.6,36.2 141.6,33.66 139.95,32 v134.24,32
  Bottom 0.254: v103.5,34.04 v121.79,34.04 | v128.78,32 v134.24,32
DAC5  (via drill 0.38)
  Top 0.254: U5.11 99.4,41.06 100.2,40.26 101.09,40.26 101.73,39.62 v101.73,36.58 | v117.6,35.94 119,35.94 120.52,37.47 120.52,38.99 122.43,40.89 R13.1
  Bottom 0.254: v101.73,36.58 101.98,36.58 102.62,35.94 v117.6,35.94
DAC6  (via drill 0.38)
  Top 0.254: U5.7 100.05,35.59 100.84,34.8 v102.36,34.8
  Top 0.305: R19.1 124.59,37.34 123.57,36.32 123.57,34.92 123.19,34.67 v122.56,34.67
  Bottom 0.254: v102.36,34.8 103.89,34.8 104.14,34.54 121.16,34.54 121.41,34.8 122.3,34.8 122.43,34.67 v122.56,34.67
DAC7  (via drill 0.38)
  Top 0.254: U5.10 100.05,41.3 100.46,40.89 101.47,40.89 102.49,39.88 102.49,37.72 v103.12,36.96 | v118.49,36.7 120.02,38.23 120.02,39.5 121.67,41.02 122.3,41.53 123.95,41.53 124.46,42.04 124.46,44.32 124.97,44.83 140.84,44.83 141.22,44.45 141.22,41.66 140.84,41.02 R12.1
  Bottom 0.254: v103.12,36.96 103.38,36.96 103.76,36.45 116.97,36.45 117.09,36.7 v118.49,36.7
DACCS
  Top 0.254: U$1.11 99.8,73.31 101.47,71.5 101.35,48.13 100.58,47.24 99.95,46.61 97.03,46.61 95.25,44.83 95.25,39.37 96.77,37.85 96.77,36.65 U5.2
DACRST  (via drill 0.38)
  Top 0.305: U5.9 100.7,43.55 101.09,43.94 v105.16,43.94 | v105.03,45.97 104.52,45.97 102.23,48.13 v102.23,65.66
  Bottom 0.305: v105.16,43.94 105.16,45.72 v105.03,45.97 | v102.23,65.66 99.55,65.79 U$1.14
EARTH  (via drill 0.6)  (3 unrouted)
  Top 1.016: 43.56,2.16 43.43,1.91 21.97,1.91 19.3,4.7 J2.S1 18.16,4.7 15.37,1.91 9.14,1.91 8.13,2.92 | 43.56,2.16 44.32,2.92 44.32,4.32 44.7,4.7 | 43.56,2.16 44.96,2.16 45.21,1.91 68.33,1.91 | 68.33,1.91 69.72,3.3 69.72,4.32 70.1,4.7 | 68.33,1.91 92.58,1.91 | 92.58,1.91 95.25,4.57 J5.S1 | 92.58,1.91 117.86,1.91 | 117.86,1.91 J6.S1 | 117.86,1.91 147.83,1.91 | 147.83,1.91 172.34,1.91 | 172.34,1.91 193.68,1.91 | 193.68,1.91 194.06,1.91 J9.S1 | 8.13,2.92 7.87,3.17 7.87,15.11 8.89,16.13 | J7.S1 146.05,3.68 147.83,1.91 | J8.S1 171.45,2.79 172.34,1.91 | 8.13,2.92 v3.3,2.92 | 193.68,1.91 212.6,1.91 v212.6,2.03 | EARTH-GND.1 v4.19,96.01 | v4.19,96.01 3.3,96.01 v4.19,96.01
  Bottom 1.016: v3.3,2.92 3.05,2.92 3.05,2.41 | v212.6,2.03 212.34,2.03 212.34,1.52 | v4.19,96.01 4.06,96.01
  pour Bottom: 4.57,104.01 -4.45,104.01 -4.45,-4.19 4.57,-4.19
  pour Top: 4.57,-1.4 -2.29,-1.4 -2.29,103.38 4.57,103.38
  pour Bottom: 211.33,-0.64 216.66,-0.64 216.66,101.22 211.33,101.22
  pour Top: 211.33,-1.91 217.17,-1.91 217.17,103.12 211.33,103.12
GND  (via drill 0.38)  (1 unrouted)
  Top 0.305: U3.25 106.83,41.37 106.3,41.91 C24.2 104.65,42.67 C25.2
  Top 0.61: C24.2 v106.3,43.94 | v104.65,48.01 104.78,48.01 106.3,46.48 v106.3,45.97 | R5.2 117.72,55.63 U$1.23
  Top 0.813: 132.97,87.63 130.62,89.97 C5.2 126.77,90.04 | U$1.38 117.18,93.81 118.62,93.85 118.75,93.73 119.51,93.09 121.03,93.09 | 121.03,93.09 121.16,93.22 | 121.03,93.09 121.16,93.09 122.43,93.09
  Top 1.016: C5.2 125.04,89.97 124.08,90.81 124.08,92.2 123.19,93.09 121.16,93.09
  Bottom 0.61: U$1.GND 106.89,48.98 v104.65,48.01 | v106.3,45.97 v106.3,43.94
  pour Bottom: 5.33,45.72 119.38,45.72 119.38,82.55 137.67,82.55 137.67,109.6 5.33,110.74
K0N  (via drill 0.38)
  Top 0.61: J2.4 22.41,6.79 23.62,8 23.62,20.19 v24.89,21.46 | v20.95,25.65 17.53,29 Q4.3
  Bottom 0.61: v24.89,21.46 24.89,21.72 v20.95,25.65
K0P  (via drill 0.38)
  Top 0.61: 21.08,35.69 C35.2 20.95,33.91 21.59,33.27 R33.1 21.59,26.67 v21.97,26.16 | J2.3 21.77,9.07 22.61,9.91 22.61,20.83 v24.89,23.11
  Bottom 0.61: v24.89,23.11 v21.97,26.16
K1N  (via drill 0.38)
  Top 0.406: Q2.3 29.42,35.22 29.46,35.18 29.34,35.18
  Top 0.61: J3.4 47.18,6.79 49.15,8.76 49.15,9.78 49.66,10.29 49.66,21.08 v49.78,21.21 | v48.39,26.54 36.2,26.54 29.21,33.53 29.21,35.09 Q2.3
  Bottom 0.61: v49.78,21.21 49.78,25.15 v48.39,26.54
K1P  (via drill 0.38)
  Top 0.406: C33.2 32.64,33.66 33.15,33.15
  Top 0.61: J3.3 47.17,9.07 48.51,10.41 v48.51,21.21 | v44.96,27.56 44.07,28.45 35.94,28.45 33.27,30.99 R32.1 33.15,33.15
  Bottom 0.61: v48.51,21.21 48.51,24 v44.96,27.56
K2N  (via drill 0.38)
  Top 0.406: 43.31,35.43 Q3.3 43.31,33.91 49.78,27.43 v49.78,27.18 | J4.4 72.96,6.79 74.55,8.38 74.55,17.91 v72.14,20.07 | v68.07,20.07 68.2,20.07 66.8,21.46 51.94,21.46 v51.05,20.95
  Bottom 0.406: v72.14,20.07 v68.07,20.07 | v51.05,20.95 51.05,25.91 v49.78,27.18
K2P  (via drill 0.38)
  Top 0.406: C34.2 46.61,34.54 47.37,33.78 R31.1 47.37,31.88 51.56,27.69 v51.56,26.67 | J4.3 72.58,9.2 73.28,9.91 73.28,17.53 v71.88,18.92 | v67.18,18.92 53.98,18.92 v52.2,20.45
  Bottom 0.406: v71.88,18.92 v67.18,18.92 | v52.2,20.45 52.2,26.04 v51.56,26.67
K3N  (via drill 0.38)  (1 unrouted)
  Top 0.406: Q1.3 53.34,33.78 59.44,27.69 63.12,27.69 v63.75,27.56 | v66.04,25.53 83.57,25.53 v84.45,25.65 | v84.45,21.59 89.79,21.59 90.93,20.45 v94.23,20.45 | 97.16,6.99 97.03,6.86 97.03,6.73 97.28,6.48 97.41,6.48 98.17,7.24 98.42,7.24 99.95,8.76 99.95,19.68 99.19,20.45 v96.52,20.45
  Bottom 0.406: v63.75,27.56 65.79,25.78 v66.04,25.53 | v84.45,25.65 v84.45,21.59 | v94.23,20.45 v96.52,20.45
K3P  (via drill 0.38)
  Top 0.406: J5.3 97.97,8.95 98.93,9.91 98.93,18.54 98.04,19.43 v96.77,19.43 | v94.11,19.3 90.68,19.3 89.28,20.7 v82.68,20.7 | v64.77,28.7 61.34,28.7 59.18,30.86 R24.1 58.55,35.18 C29.2 | v66.93,26.42 v82.68,26.42
  Top 0.61: J5.3 98.42,8.89
  Bottom 0.406: v96.77,19.43 94.36,19.43 v94.11,19.3 | v64.77,28.7 64.9,28.45 v66.93,26.42 | v82.68,26.42 v82.68,20.7
K4N  (via drill 0.38)
  Top 0.406: J6.4 123,6.66 125.09,8.76 125.09,13.08 125.73,13.72 135.38,13.72 v140.46,18.54 | v146.3,27.05 148.21,28.96 150.32,28.96 Q5.3
  Bottom 0.406: v140.46,18.54 140.46,21.21 v146.3,27.05
K4P  (via drill 0.38)
  Top 0.406: 145.67,34.16 C36.2 145.41,32.38 146.05,31.75 R35.1 144.78,29.72 v144.78,26.67 | J6.3 123.38,8.95 124.21,9.78 124.21,13.72 125.09,14.61 135,14.61 135.13,14.73 v139.32,18.8
  Bottom 0.406: v139.32,18.8 139.32,21.21 v144.78,26.67
K5N  (via drill 0.38)  (1 unrouted)
  Top 0.406: J7.4 149.16,6.79 150.88,8.51 150.88,21.08 v150.37,21.59 | v149.99,26.54 158.58,26.54 Q6.3
  Bottom 0.406: v150.37,21.59 150.37,25.93 149.99,26.57
K5P  (via drill 0.38)
  Top 0.406: R37.1 155.83,30.86 | 155.83,30.86 155.83,31.37 155.19,32 C38.2 | J7.3 148.78,10.09 150.11,11.43 150.11,20.32 v148.72,21.72 | v148.59,26.8 148.84,26.8 149.61,27.56 154.18,27.56 155.57,28.96 155.57,30.61 155.83,30.86
  Bottom 0.406: v148.72,21.72 148.72,26.54 v148.59,26.8
K6N  (via drill 0.38)
  Top 0.406: Q7.3 176.49,25.78 176.02,25.78 v175.9,25.65 | J8.4 174.05,6.79 175.77,8.51 v175.77,22.61
  Bottom 0.406: v175.77,22.61 175.77,25.53 v175.9,25.65
K6P  (via drill 0.38)
  Top 0.406: C37.2 173.99,33.78 173.99,30.48 R38.1 v174.12,25.65 | J8.3 174.18,8.95 174.88,9.65 174.88,21.72 v173.99,22.61
  Top 0.61: R38.1 174.12,33.66 173.99,33.78
  Bottom 0.406: v173.99,22.61 173.99,25.53 v174.12,25.65
K7N
  Top 0.406: J9.4 199.83,6.79 201.17,8.13 201.17,19.3 193.42,27.05 192.19,27.05 Q8.3
K7P
  Top 0.406: 184.02,33.78 184.28,34.04 C39.2 184.66,33.4 R36.1 184.78,30.86 | 184.66,30.86 184.78,30.86 | 184.78,30.86 184.78,28.32 187.32,25.78 193.17,25.78 200.15,18.8 200.15,9.65 199.57,9.07 J9.3
LDAC
  Top 0.254: U5.1 96.15,37.58 94.61,39.12 94.61,45.72 96.27,47.37 99.44,47.37 100.71,48.64 100.71,69.98 99.44,70.99 98.81,70.98 U$1.12
N$1
  Top 0.28: U1.P$3 131.27,76.56 133.03,74.8
  Top 0.61: C13.2 132.95,74.68 133.03,74.8 133.03,76.21 133.85,76.61 R3.2 134.73,75.02 134.7,74.34 R4.1
N$2
  Top 0.305: C24.1 109.07,42.67 U3.24
N$3
  Top 0.406: Q7.1 181.54,31.94 R29.1
N$4
  Top 0.61: R27.1 191.52,31.93 Q8.1
N$5  (1 unrouted)
  Top 0.406: R18.1 55.37,36.45 55.12,36.7 55.12,37.34 54.36,38.1 | 54.1,37.97 54.27,37.85 Q1.1
N$6
  Top 0.406: Q6.1 162.62,33.59 R30.1
N$7  (1 unrouted)
  Top 0.406: 152.27,32.44 Q5.1
  Top 0.61: R28.1 152.78,32.51 152.4,32.13
N$8
  Top 0.406: R15.1 19.68,38.61 18.54,37.47 18.54,36.63 Q4.1
N$9
  Top 0.406: R14.1 30.73,39.24 30.35,38.86 30.35,37.39 Q2.1
N$11  (1 unrouted)
  Top 0.406: Q3.1 44.26,37.65 45.21,38.61 47.37,38.61
N$12
  Top 0.254: R10.1 72.64,42.04 U4.2 76.33,42.04 76.96,42.67 76.96,43.69 76.2,44.45 72.64,44.45 R6.2
N$13
  Top 0.305: U4.6 73.91,36.96 72.26,37.97 72.14,37.34 71.88,36.96 70.74,36.96 70.48,36.7 70.48,36.07 R22.1
  Top 0.61: 72.26,37.97 72.26,38.23 R17.2
N$15
  Top 0.254: U6.9 137.92,36.58 R20.2 | 138.56,37.21 R20.2 | R26.1 140.21,35.31 139.7,35.81 138.68,35.81 138.43,36.07 R20.2
N$18  (via drill 0.4)
  Top 0.254: U1.P$14 124.72,75.91 v124.12,75.56 | v124.12,77.46 124.12,78.09 C10.1
  Bottom 0.254: v124.12,75.56 v124.12,77.46
N$19  (1 unrouted)
  Top 0.305: U6.2 127.76,41.66 R13.2 127,41.4 126.62,42.16 125.86,42.16 125.22,42.55 125.22,43.18
N$20  (1 unrouted)
  Top 0.305: U4.9 81.92,36.96 82.93,36.83 R25.1
N$22  (2 unrouted)
  Top 0.305: U6.6 127.64,36.58 126.75,37.47 | R23.1 125.09,35.43 125.73,36.07 126.62,36.07 126.87,36.32 126.87,37.47 126.75,37.59
N$23
  Top 0.28: 147.09,77.13 147,77.12 C11.1 146.81,77.03 U2.P$14
N$24
  Top 0.305: R8.1 140.08,42.67 139.7,42.29 138.43,42.29 138.18,42.04 138.18,41.15 R12.2 138.18,41.02 137.67,41.53 135.38,41.53 135.13,41.78 135.41,41.78 U6.13
N$25
  Top 0.305: R7.1 84.71,43.43 84.07,42.8 83.06,42.8 82.93,42.67 82.93,41.78 | 82.93,41.78 R11.2 | U4.13 81.92,42.04 82.93,41.78
R0
  Top 0.406: U$1.16 38.13,60.73 23.11,45.72 23.11,38.86 R15.2
R1
  Top 0.406: U$1.17 43.46,58.19 35.05,49.78 R14.2
R2
  Top 0.406: U$1.19 94.97,53.11 90.17,53.09 52.45,53.09 48.77,49.91 48.77,38.86 R16.2
R3
  Top 0.406: U$1.20 94.97,50.57 90.68,50.67 59.18,50.67 56.64,48.39 56.64,38.35 R18.2
R4
  Top 0.305: U$1.21 142.85,50.57 151,42.55 R28.2
R5  (1 unrouted)
  Top 0.305: U$1.22 144.37,53.11 160.78,37.34 160.78,33.91 160.66,33.78
R6
  Top 0.305: U$1.24 149.45,58.19 169.04,38.61 176.91,38.61 179.83,35.69 R29.2 179.71,33.78
R7
  Top 0.305: U$1.25 151.99,60.73 171.07,41.91 183.26,41.91 189.1,35.81 189.74,35.18 R27.2
RGND  (via drill 0.38)  (1 unrouted)
  Top 0.61: Q4.2 16.58,40.96 20.83,45.21 20.83,45.47 v20.95,45.59 20.95,45.97 66.93,92.46 117.98,92.46 119.25,91.19 121.03,91.19 121.16,91.31 R2.1 | Q3.2 42.36,45.15 v42.93,45.59 | Q1.2 52.39,45.28 v52.96,45.85 | Q2.2 28.39,44.64 v29.59,45.85 28.96,46.48 C23.2 | Q5.2 150.31,32.19 149.73,32.77 149.73,42.42 v146.05,46.1 145.92,46.1 145.29,46.74 C18.2 | Q6.2 159.91,31.73 159.64,32 159.64,36.96 v150.62,45.97 | Q7.2 179.01,31.56 178.44,32.13 178.44,35.56 176.66,37.34 164.34,37.34 156.59,45.09 156.59,45.72 v156.46,45.85 156.97,46.35 C17.2 | Q8.2 189.04,31.81 188.59,32.26 188.59,35.05 183.01,40.64 170.31,40.64 v165.48,45.59 | C19.2 38.1,46.61 v37.21,45.72 | C21.2 60.2,46.61 v60.71,46.1 | C16.2 167.26,46.86 165.35,48.77 v165.35,49.53 | C22.2 122.68,48.39 123.32,47.75 v123.32,45.97 | C20.2 45.97,46.61 v45.09,45.72
  Bottom 0.61: v20.95,45.59 29.72,45.59 | 29.72,45.59 37.08,45.59 | 37.08,45.59 v42.93,45.59 45.09,45.59 | 52.96,46.1 51.94,45.59 45.09,45.59 | 52.96,46.1 v60.71,46.1 | v60.71,46.1 103.63,46.1 104.52,46.99 114.55,46.99 116.08,45.72 123.06,45.72 | 123.06,45.72 146.05,45.72 | 146.05,45.72 150.62,45.72 | 150.62,45.72 156.46,45.59 | 156.46,45.59 165.1,45.59 | v52.96,45.85 52.96,46.1 | v29.59,45.85 29.59,45.72 29.72,45.59 | v146.05,46.1 146.05,45.72 | v150.62,45.97 150.62,45.72 | v165.48,45.59 165.35,45.97 v165.35,49.53 | v37.21,45.72 37.08,45.59 | 60.71,45.97 v60.71,46.1 | v123.32,45.97 123.06,45.72 | v45.09,45.72 45.09,45.59 | v156.46,45.85 156.46,45.59
SPIOCLK  (via drill 0.38)
  Top 0.254: U$1.4 101.09,89.52 101.09,85.6 100.33,84.84 98.42,84.84 97.92,84.2 97.92,83.06 98.55,82.42 99.95,82.42 100.71,81.53 100.58,80.14 114.05,66.93 114.05,50.16 111.75,47.64 111.75,45.21 | U3.19 111.75,45.21 | U5.16 96.15,44.33 97.03,45.21 v108.97,45.21 | v112.14,45.21 111.75,45.21
  Bottom 0.254: v108.97,45.21 v112.14,45.21
SPIORX
  Top 0.254: U$1.6 99.55,86.11 99.19,86.23 97.79,86.23 96.9,85.34 96.9,81.79 98.81,79.63 100.08,79.63 113.28,66.42 113.28,50.55 111.51,48.77 111.25,48.52 U3.20
SPIOTX  (via drill 0.38)
  Top 0.254: U$1.5 96.14,85.67 96.14,79.38 98.3,77.22 101.22,77.22 112.52,66.04 112.52,50.93 110.74,49.02 110.75,48.76 110.75,44.7 | U3.21 110.75,44.7 | U5.15 96.8,44.09 97.28,44.7 107.57,44.7 v107.95,44.45 | v110.49,44.45 110.62,44.58 110.75,44.7
  Bottom 0.254: v107.95,44.45 v110.49,44.45
VIN+
  Top 0.305: U2.P$15 145.99,78.42 145.92,78.49 | U2.P$13 150.68,76.39 151,76.71 151,77.85 150.37,78.49 148.21,78.49 145.92,78.49 | 145.92,78.49 145.67,78.74 144.94,78.74 U2.P$16 144.89,79.61 144.91,79.63
  Top 0.61: L1.2 161.8,94.79 | 161.8,94.79 161.88,94.79 C2.1 | 161.8,94.79 161.85,94.74 163.32,94.74 163.7,94.37 C1.1 166.12,94.36 167.39,93.09 167.39,83.57 164.47,80.64 149.48,80.64 148.21,79.38 148.21,78.49
VIN-
  Top 0.305: U1.P$13 123.42,76.56 123.06,76.2 123.06,75.95 123.06,74.93 123.32,74.68 125.22,74.68 125.28,74.74 | 125.28,74.74 125.35,74.8 125.35,75.21 U1.P$15 | U1.P$16 125.87,74.16 125.28,74.74
  Top 0.406: L2.2 C8.1
  Top 0.61: 123.06,75.95 121.92,75.95 121.54,76.33 121.54,80.26 121.79,80.52 126.11,80.52 126.87,81.28 146.69,81.28 148.08,82.68 157.73,82.68 159.38,84.33 L2.2 | C6.1 163.92,87.72 163.45,87.25 C8.1
VOFF  (via drill 0.38)  (1 unrouted)
  Top 0.305: U6.3 130.68,40.39 131.19,39.88 | U6.12 133.73,40.39 v133.22,39.88 133.22,38.61 133.86,37.97 135.41,37.97 U6.10 | v131.32,39.88 131.19,39.88 | 131.19,39.88 131.32,39.75 131.32,38.23 130.81,37.85 U6.5 128.27,37.85 127.64,38.48 124.21,38.48 120.9,35.18 v120.9,33.27 | v102.49,33.27 90.68,33.27 90.42,33.02 v90.17,33.02 90.39,32.8 U7.4 91.25,31.18 91.69,30.73 91.69,29.59 92.08,29.21 92.93,29.21 | v83.69,32.38 81.66,32.38 78.99,35.05 78.99,37.47 79.76,38.23 U4.10 | U4.5 73.28,38.23 73.15,38.35 73.15,40.51 73.41,40.77 U4.3
  Top 0.406: U4.3 U4.12 81.03,40.87 81.03,40.89 81.41,40.51 82.3,40.51 82.93,39.88 82.93,38.86 82.3,38.23 U4.10
  Bottom 0.305: v133.22,39.88 v131.32,39.88 131.19,39.88 | v120.9,33.27 120.52,33.53 104.27,33.53 104.01,33.27 v102.49,33.27 | v90.17,33.02 84.33,33.02 v83.69,32.38
VS0  (1 unrouted)
  Top 0.254: 67.06,29.84 68.45,31.37 68.45,39.62 70.1,41.27 | U4.1 73.91,43.31 73.41,43.05 71.25,43.05 70.23,41.91 R10.2
  Top 0.406: 67.06,29.84 64.01,26.54 53.09,26.54 52.07,25.53 22.73,25.53 16.26,19.05 16.26,15.62 16.2,10.67 17.73,9.14 17.78,8.13 19.05,6.86 J2.5
VS1  (via drill 0.38)
  Top 0.254: R22.2 72.14,33.02 67.44,28.32
  Top 0.305: R22.2 74.65,35.81 U4.7
  Top 0.406: J3.5 44.45,6.86 43.31,8 43.31,9.02 42.29,10.03 42.04,10.03 41.4,10.67 41.4,20.57 44.07,23.5 v53.72,23.5 | v54.23,25.65 64.77,25.65 67.44,28.32
  Bottom 0.406: v53.72,23.5 53.72,25.15 v54.23,25.65
VS2  (via drill 0.38)  (2 unrouted)
  Top 0.305: 84.71,33.78 85.47,33.15 | 85.47,33.15 86.23,32.38 | 85.47,33.15 81.92,33.15 80.9,34.29 80.9,35.56
  Top 0.406: J4.5 69.85,6.99 68.45,8.38 68.45,9.27 67.06,10.67 67.06,17.27 69.22,19.43 69.22,22.1 v69.6,22.48 | v71.5,27.3 85.34,27.3 86.23,28.07 86.23,32.38
  Bottom 0.406: v69.6,22.48 69.6,25.53 v71.5,27.3
VS3  (via drill 0.38)
  Top 0.254: R7.2 82.93,44.7 83.69,45.47 86.11,45.47 86.81,44.51 86.87,44.45
  Top 0.305: U4.14 R7.2
  Top 0.406: J5.5 95.25,6.86 93.98,8.13 93.98,9.14 93.34,9.78 92.46,10.54 92.46,13.46 v85.98,19.81 | v85.98,25.53 87,26.54 87,44.32 86.81,44.51
  Bottom 0.406: v85.98,19.81 v85.98,25.53
VS4  (via drill 0.38)  (1 unrouted)
  Top 0.254: U6.8 137.67,35.31 R26.2 138.3,34.42
  Top 0.305: U6.8 134.11,35.31 132.21,33.4 132.21,27.81 v131.7,27.3 | v131.7,19.81 131.32,19.3 124.59,19.3 123.44,18.03 123.44,10.67 122.17,9.4 122.17,8.26 120.52,6.6
  Bottom 0.305: v131.7,27.3 v131.7,19.81
VS5  (via drill 0.38)
  Top 0.254: J7.5 145.99,6.79 144.53,8.26 144.53,9.4 143.38,10.54 143.38,19.68 142.43,20.57 | R9.2 129.01,43.31 U6.1
  Top 0.305: U6.1 131.95,42.93 132.33,42.55 132.33,35.18 130.56,33.4 130.56,27.56 v130.68,27.3 | v130.68,20.32 130.81,20.32 131.06,20.57 142.43,20.57
  Bottom 0.305: v130.68,27.3 v130.68,20.32
VS6  (via drill 0.38)
  Top 0.305: U6.7 129.16,35.31 | 129.16,35.31 127.38,35.31 R23.2 | J8.5 171.39,6.79 170.18,8 170.18,9.14 168.66,10.67 168.66,20.19 167.64,21.34 158.24,21.34 156.59,22.73 129.92,22.73 v129.67,22.48 | v129.67,27.3 129.67,27.43 129.79,27.56 129.79,34.67 129.16,35.31
  Bottom 0.305: v129.67,22.48 v129.67,27.3
VS7  (via drill 0.38)  (1 unrouted)
  Top 0.254: J9.5 196.79,6.79 195.58,8 195.58,9.14 193.68,11.05 193.68,21.59 191.64,23.62 162.05,23.62 v161.54,23.37 | v161.42,25.78 144.27,25.78 143.13,26.67 143.13,40.89 v142.88,41.15 | 138.05,43.31 137.54,43.69 v137.03,43.69 136.27,43.69 135.53,43.08 U6.14
  Bottom 0.254: v161.54,23.37 161.54,25.65 v161.42,25.78 | v142.88,41.15 139.7,41.15 v137.03,43.69
VUSB  (4 unrouted)
  Top 0.813: 126.87,92.71 126.75,92.58 126.75,92.71 129.03,95 132.59,95 132.97,95.38
  Top 1.016: 127.13,92.96 127.13,92.84 126.62,93.34 126.62,96.77 125.6,97.79 122.3,97.79 121.26,98.83 U$1.40

## Text on the board
tPlace: EPG Control Board | 20261109 | +5 | GND | -5 | EARTH | S | S